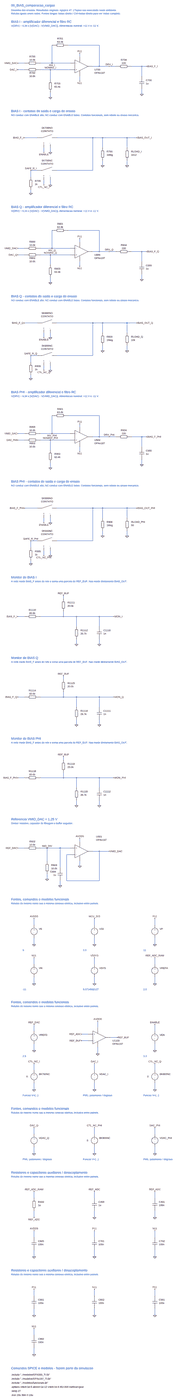
[diagram p0: schematic 06_BIAS_comparacao_cargas.asc, whole sheet]
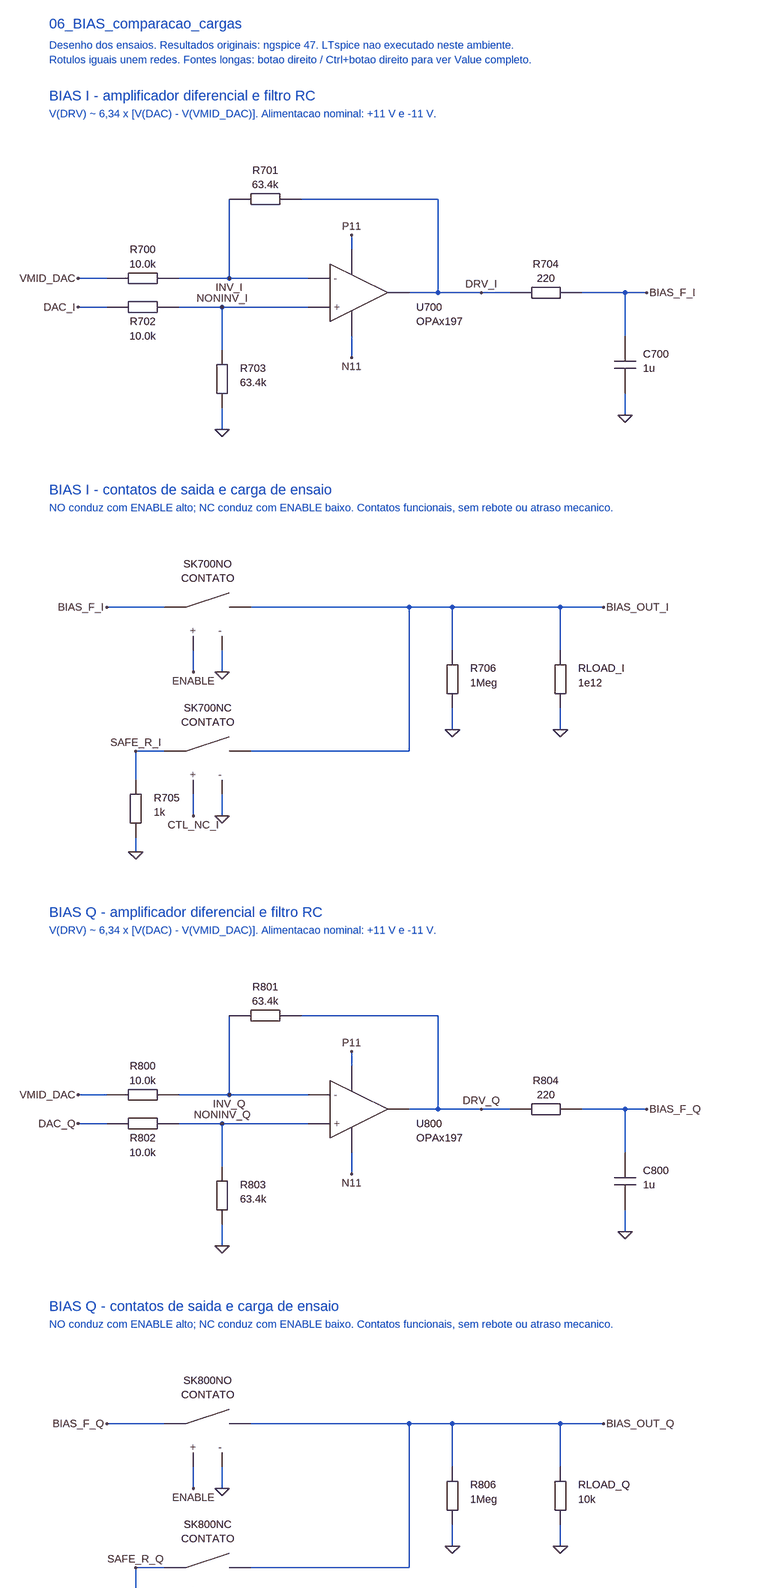
[diagram p1: schematic 06_BIAS_comparacao_cargas.asc, part, row 1 of 4, column 1 of 1]
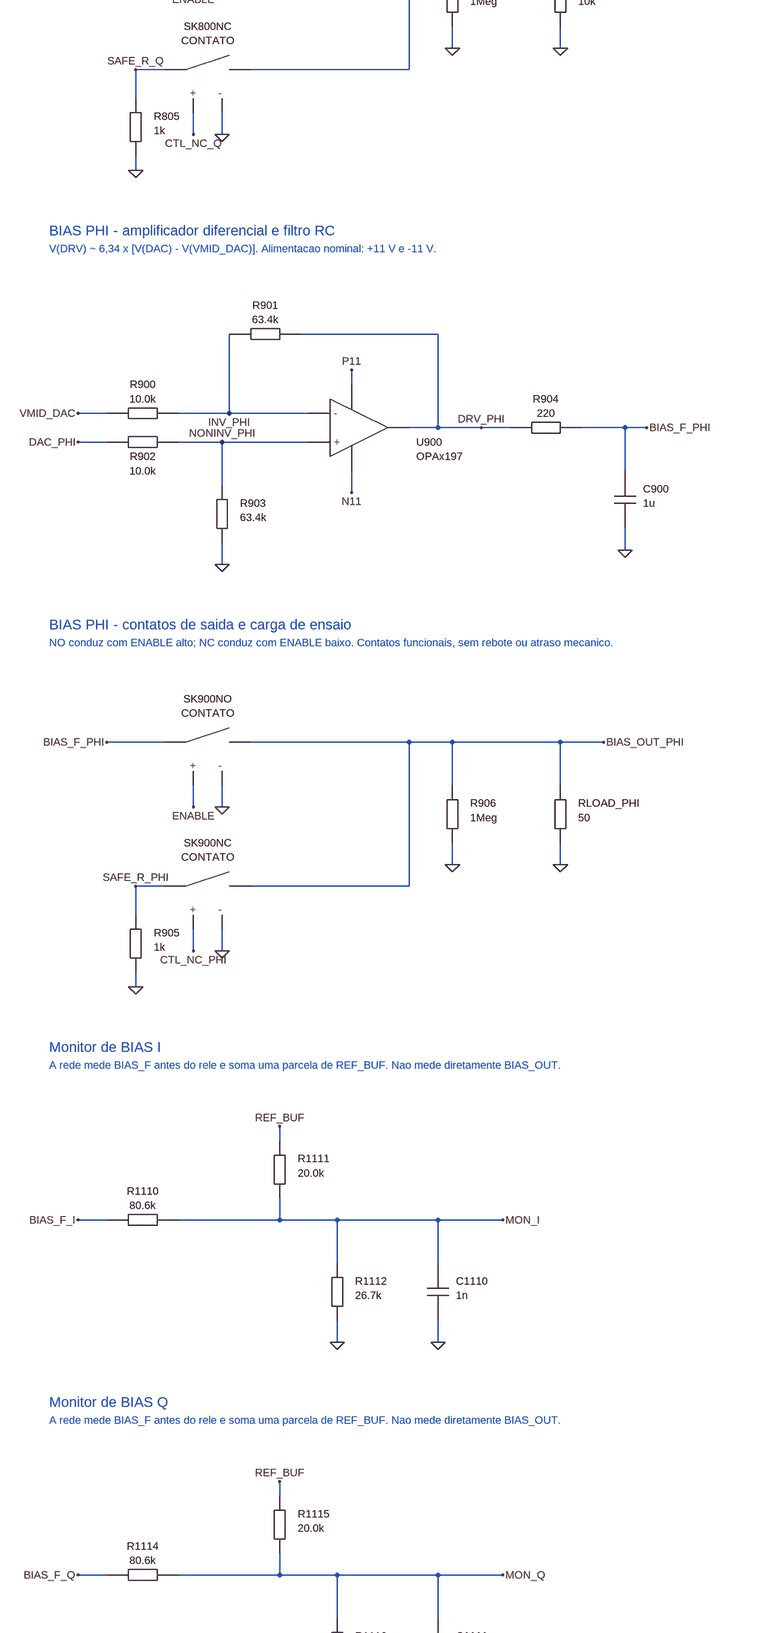
[diagram p2: schematic 06_BIAS_comparacao_cargas.asc, part, row 2 of 4, column 1 of 1]
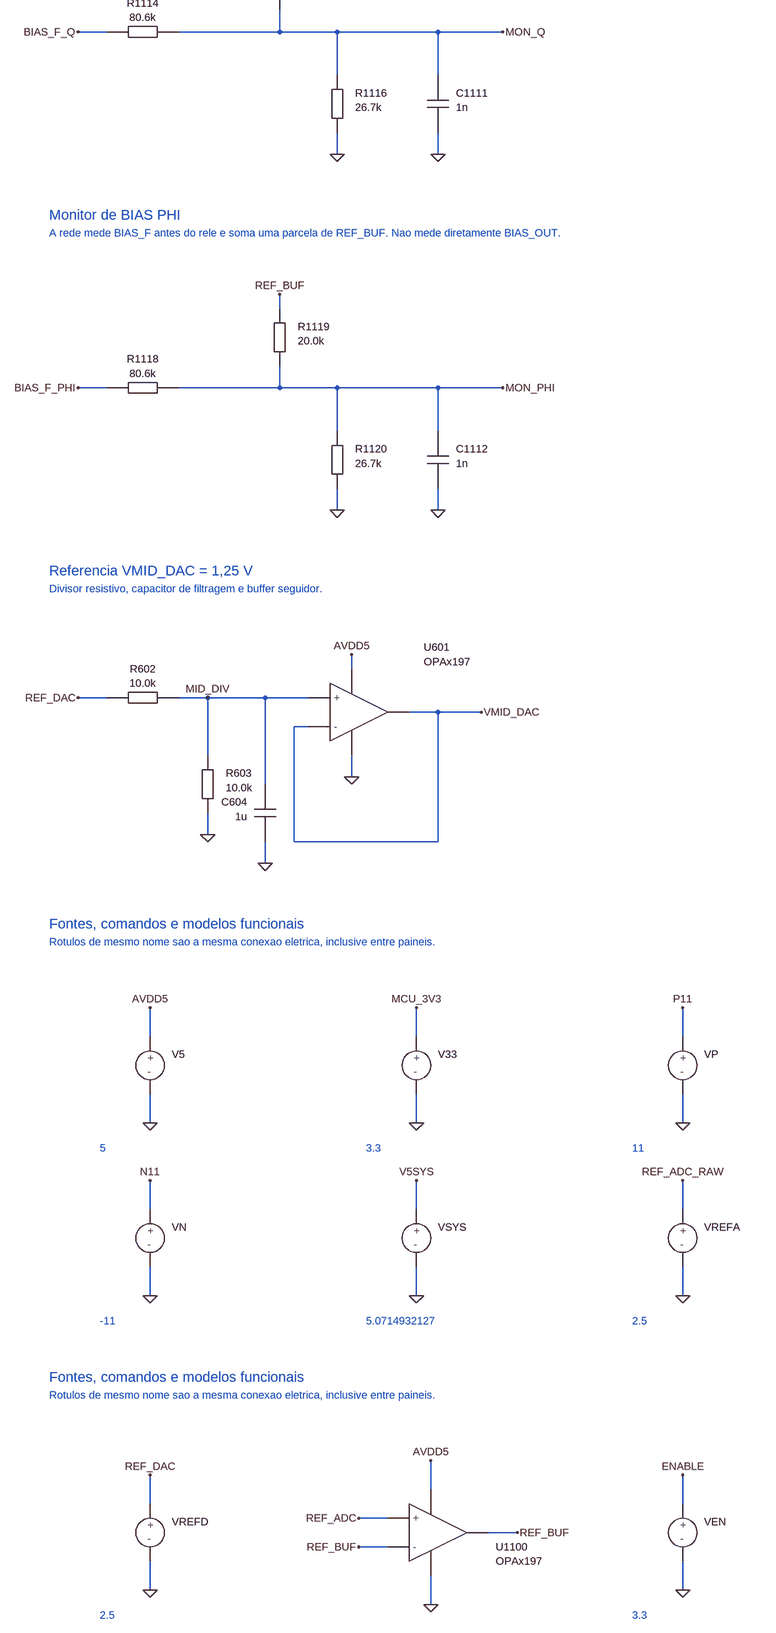
[diagram p3: schematic 06_BIAS_comparacao_cargas.asc, part, row 3 of 4, column 1 of 1]
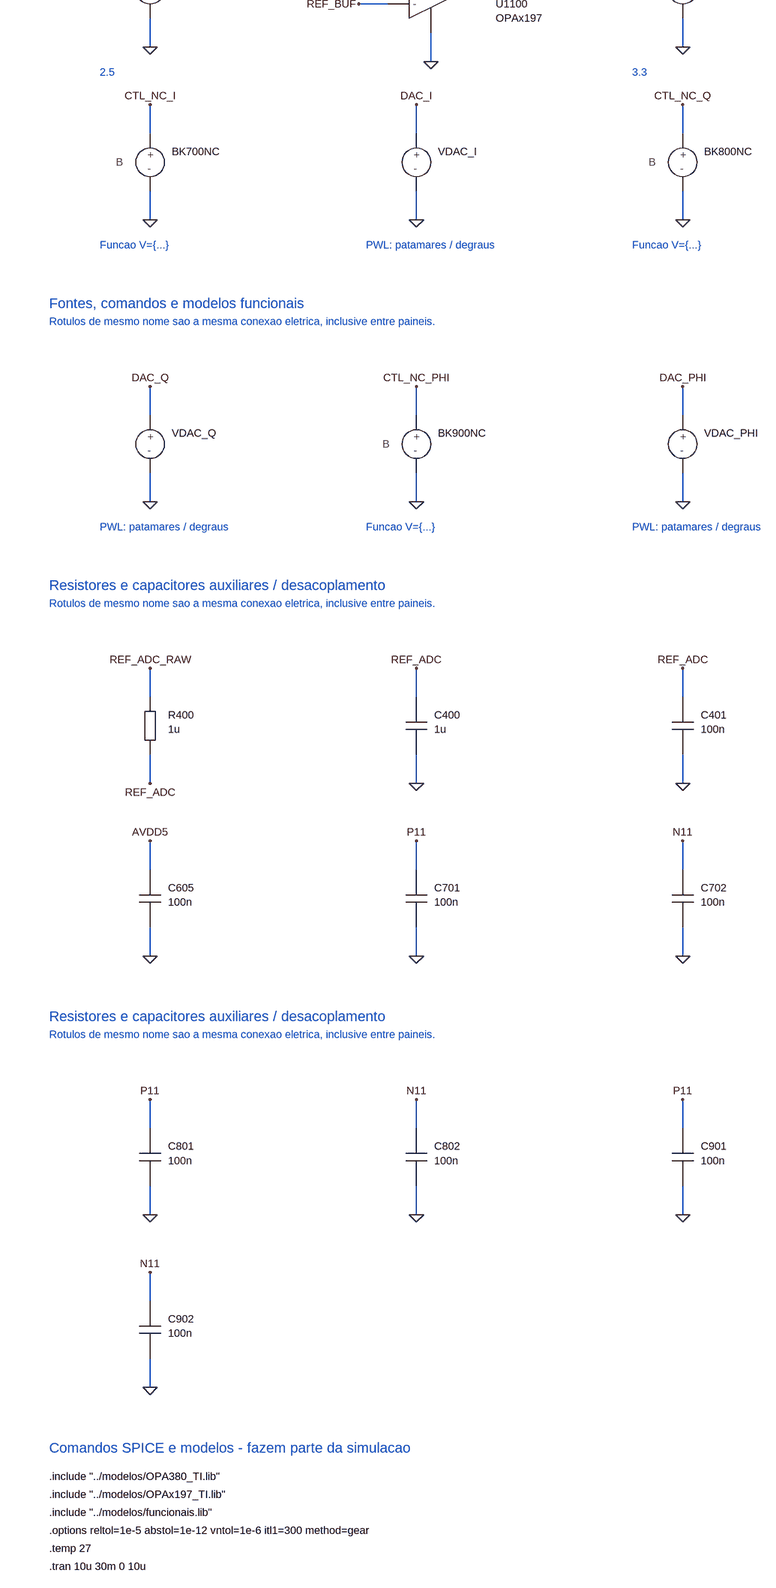
[diagram p4: schematic 06_BIAS_comparacao_cargas.asc, part, row 4 of 4, column 1 of 1]
06_BIAS_comparacao_cargas.asc, the LTspice schematic file:
Version 4.1
SHEET 1 1968 16096
TEXT 64 32 Left 3 ;06_BIAS_comparacao_cargas
TEXT 64 80 Left 2 ;Desenho dos ensaios. Resultados originais: ngspice 47. LTspice nao executado neste ambiente.
TEXT 64 112 Left 2 ;Rotulos iguais unem redes. Fontes longas: botao direito / Ctrl+botao direito para ver Value completo.
TEXT 64 192 Left 3 ;BIAS I - amplificador diferencial e filtro RC
TEXT 64 232 Left 2 ;V(DRV) ~ 6,34 x [V(DAC) - V(VMID_DAC)]. Alimentacao nominal: +11 V e -11 V.
WIRE 192 608 128 608
WIRE 352 608 640 608
WIRE 464 608 464 432
WIRE 624 432 928 432
WIRE 928 432 928 640
WIRE 928 640 864 640
WIRE 192 672 128 672
WIRE 352 672 640 672
WIRE 448 672 448 768
WIRE 448 896 448 944
WIRE 736 544 736 512
WIRE 736 736 736 784
WIRE 928 640 1088 640
WIRE 1248 640 1392 640
WIRE 1344 640 1344 736
WIRE 1344 864 1344 912
FLAG 128 608 VMID_DAC
FLAG 128 672 DAC_I
FLAG 448 944 0
FLAG 736 512 P11
FLAG 736 784 N11
FLAG 1024 640 DRV_I
FLAG 1392 640 BIAS_F_I
FLAG 1344 912 0
FLAG 464 608 INV_I
FLAG 448 672 NONINV_I
SYMBOL CV_RH 192 608 R0
SYMATTR InstName R700
SYMATTR Value 10.0k
SYMBOL CV_RHR 464 432 R0
SYMATTR InstName R701
SYMATTR Value 63.4k
SYMBOL CV_RHB 192 672 R0
SYMATTR InstName R702
SYMATTR Value 10.0k
SYMBOL CV_RV 448 768 R0
SYMATTR InstName R703
SYMATTR Value 63.4k
SYMBOL CV_OPD 704 576 R0
SYMATTR InstName U700
SYMATTR Value OPAx197
SYMBOL CV_RH 1088 640 R0
SYMATTR InstName R704
SYMATTR Value 220
SYMBOL CV_CV 1344 736 R0
SYMATTR InstName C700
SYMATTR Value 1u
TEXT 64 1200 Left 3 ;BIAS I - contatos de saida e carga de ensaio
TEXT 64 1240 Left 2 ;NO conduz com ENABLE alto; NC conduz com ENABLE baixo. Contatos funcionais, sem rebote ou atraso mecanico.
WIRE 320 1584 192 1584
WIRE 512 1584 1296 1584
WIRE 512 1904 864 1904
WIRE 864 1904 864 1584
WIRE 384 1680 384 1728
WIRE 448 1680 448 1728
WIRE 384 2000 384 2048
WIRE 448 2000 448 2048
WIRE 320 1904 256 1904
WIRE 256 1904 256 1968
WIRE 256 2096 256 2128
WIRE 960 1584 960 1680
WIRE 960 1808 960 1856
WIRE 1200 1584 1200 1680
WIRE 1200 1808 1200 1856
FLAG 192 1584 BIAS_F_I
FLAG 1296 1584 BIAS_OUT_I
FLAG 384 1728 ENABLE
FLAG 448 1728 0
FLAG 384 2048 CTL_NC_I
FLAG 448 2048 0
FLAG 256 1904 SAFE_R_I
FLAG 256 2128 0
FLAG 960 1856 0
FLAG 1200 1856 0
SYMBOL CV_SW 384 1584 R0
SYMATTR InstName SK700NO
SYMATTR Value CONTATO
SYMBOL CV_SW 384 1904 R0
SYMATTR InstName SK700NC
SYMATTR Value CONTATO
SYMBOL CV_RV 256 1968 R0
SYMATTR InstName R705
SYMATTR Value 1k
SYMBOL CV_RV 960 1680 R0
SYMATTR InstName R706
SYMATTR Value 1Meg
SYMBOL CV_RV 1200 1680 R0
SYMATTR InstName RLOAD_I
SYMATTR Value 1e12
TEXT 64 2352 Left 3 ;BIAS Q - amplificador diferencial e filtro RC
TEXT 64 2392 Left 2 ;V(DRV) ~ 6,34 x [V(DAC) - V(VMID_DAC)]. Alimentacao nominal: +11 V e -11 V.
WIRE 192 2768 128 2768
WIRE 352 2768 640 2768
WIRE 464 2768 464 2592
WIRE 624 2592 928 2592
WIRE 928 2592 928 2800
WIRE 928 2800 864 2800
WIRE 192 2832 128 2832
WIRE 352 2832 640 2832
WIRE 448 2832 448 2928
WIRE 448 3056 448 3104
WIRE 736 2704 736 2672
WIRE 736 2896 736 2944
WIRE 928 2800 1088 2800
WIRE 1248 2800 1392 2800
WIRE 1344 2800 1344 2896
WIRE 1344 3024 1344 3072
FLAG 128 2768 VMID_DAC
FLAG 128 2832 DAC_Q
FLAG 448 3104 0
FLAG 736 2672 P11
FLAG 736 2944 N11
FLAG 1024 2800 DRV_Q
FLAG 1392 2800 BIAS_F_Q
FLAG 1344 3072 0
FLAG 464 2768 INV_Q
FLAG 448 2832 NONINV_Q
SYMBOL CV_RH 192 2768 R0
SYMATTR InstName R800
SYMATTR Value 10.0k
SYMBOL CV_RHR 464 2592 R0
SYMATTR InstName R801
SYMATTR Value 63.4k
SYMBOL CV_RHB 192 2832 R0
SYMATTR InstName R802
SYMATTR Value 10.0k
SYMBOL CV_RV 448 2928 R0
SYMATTR InstName R803
SYMATTR Value 63.4k
SYMBOL CV_OPD 704 2736 R0
SYMATTR InstName U800
SYMATTR Value OPAx197
SYMBOL CV_RH 1088 2800 R0
SYMATTR InstName R804
SYMATTR Value 220
SYMBOL CV_CV 1344 2896 R0
SYMATTR InstName C800
SYMATTR Value 1u
TEXT 64 3360 Left 3 ;BIAS Q - contatos de saida e carga de ensaio
TEXT 64 3400 Left 2 ;NO conduz com ENABLE alto; NC conduz com ENABLE baixo. Contatos funcionais, sem rebote ou atraso mecanico.
WIRE 320 3744 192 3744
WIRE 512 3744 1296 3744
WIRE 512 4064 864 4064
WIRE 864 4064 864 3744
WIRE 384 3840 384 3888
WIRE 448 3840 448 3888
WIRE 384 4160 384 4208
WIRE 448 4160 448 4208
WIRE 320 4064 256 4064
WIRE 256 4064 256 4128
WIRE 256 4256 256 4288
WIRE 960 3744 960 3840
WIRE 960 3968 960 4016
WIRE 1200 3744 1200 3840
WIRE 1200 3968 1200 4016
FLAG 192 3744 BIAS_F_Q
FLAG 1296 3744 BIAS_OUT_Q
FLAG 384 3888 ENABLE
FLAG 448 3888 0
FLAG 384 4208 CTL_NC_Q
FLAG 448 4208 0
FLAG 256 4064 SAFE_R_Q
FLAG 256 4288 0
FLAG 960 4016 0
FLAG 1200 4016 0
SYMBOL CV_SW 384 3744 R0
SYMATTR InstName SK800NO
SYMATTR Value CONTATO
SYMBOL CV_SW 384 4064 R0
SYMATTR InstName SK800NC
SYMATTR Value CONTATO
SYMBOL CV_RV 256 4128 R0
SYMATTR InstName R805
SYMATTR Value 1k
SYMBOL CV_RV 960 3840 R0
SYMATTR InstName R806
SYMATTR Value 1Meg
SYMBOL CV_RV 1200 3840 R0
SYMATTR InstName RLOAD_Q
SYMATTR Value 10k
TEXT 64 4512 Left 3 ;BIAS PHI - amplificador diferencial e filtro RC
TEXT 64 4552 Left 2 ;V(DRV) ~ 6,34 x [V(DAC) - V(VMID_DAC)]. Alimentacao nominal: +11 V e -11 V.
WIRE 192 4928 128 4928
WIRE 352 4928 640 4928
WIRE 464 4928 464 4752
WIRE 624 4752 928 4752
WIRE 928 4752 928 4960
WIRE 928 4960 864 4960
WIRE 192 4992 128 4992
WIRE 352 4992 640 4992
WIRE 448 4992 448 5088
WIRE 448 5216 448 5264
WIRE 736 4864 736 4832
WIRE 736 5056 736 5104
WIRE 928 4960 1088 4960
WIRE 1248 4960 1392 4960
WIRE 1344 4960 1344 5056
WIRE 1344 5184 1344 5232
FLAG 128 4928 VMID_DAC
FLAG 128 4992 DAC_PHI
FLAG 448 5264 0
FLAG 736 4832 P11
FLAG 736 5104 N11
FLAG 1024 4960 DRV_PHI
FLAG 1392 4960 BIAS_F_PHI
FLAG 1344 5232 0
FLAG 464 4928 INV_PHI
FLAG 448 4992 NONINV_PHI
SYMBOL CV_RH 192 4928 R0
SYMATTR InstName R900
SYMATTR Value 10.0k
SYMBOL CV_RHR 464 4752 R0
SYMATTR InstName R901
SYMATTR Value 63.4k
SYMBOL CV_RHB 192 4992 R0
SYMATTR InstName R902
SYMATTR Value 10.0k
SYMBOL CV_RV 448 5088 R0
SYMATTR InstName R903
SYMATTR Value 63.4k
SYMBOL CV_OPD 704 4896 R0
SYMATTR InstName U900
SYMATTR Value OPAx197
SYMBOL CV_RH 1088 4960 R0
SYMATTR InstName R904
SYMATTR Value 220
SYMBOL CV_CV 1344 5056 R0
SYMATTR InstName C900
SYMATTR Value 1u
TEXT 64 5520 Left 3 ;BIAS PHI - contatos de saida e carga de ensaio
TEXT 64 5560 Left 2 ;NO conduz com ENABLE alto; NC conduz com ENABLE baixo. Contatos funcionais, sem rebote ou atraso mecanico.
WIRE 320 5904 192 5904
WIRE 512 5904 1296 5904
WIRE 512 6224 864 6224
WIRE 864 6224 864 5904
WIRE 384 6000 384 6048
WIRE 448 6000 448 6048
WIRE 384 6320 384 6368
WIRE 448 6320 448 6368
WIRE 320 6224 256 6224
WIRE 256 6224 256 6288
WIRE 256 6416 256 6448
WIRE 960 5904 960 6000
WIRE 960 6128 960 6176
WIRE 1200 5904 1200 6000
WIRE 1200 6128 1200 6176
FLAG 192 5904 BIAS_F_PHI
FLAG 1296 5904 BIAS_OUT_PHI
FLAG 384 6048 ENABLE
FLAG 448 6048 0
FLAG 384 6368 CTL_NC_PHI
FLAG 448 6368 0
FLAG 256 6224 SAFE_R_PHI
FLAG 256 6448 0
FLAG 960 6176 0
FLAG 1200 6176 0
SYMBOL CV_SW 384 5904 R0
SYMATTR InstName SK900NO
SYMATTR Value CONTATO
SYMBOL CV_SW 384 6224 R0
SYMATTR InstName SK900NC
SYMATTR Value CONTATO
SYMBOL CV_RV 256 6288 R0
SYMATTR InstName R905
SYMATTR Value 1k
SYMBOL CV_RV 960 6000 R0
SYMATTR InstName R906
SYMATTR Value 1Meg
SYMBOL CV_RV 1200 6000 R0
SYMATTR InstName RLOAD_PHI
SYMATTR Value 50
TEXT 64 6672 Left 3 ;Monitor de BIAS I
TEXT 64 6712 Left 2 ;A rede mede BIAS_F antes do rele e soma uma parcela de REF_BUF. Nao mede diretamente BIAS_OUT.
WIRE 192 7056 128 7056
WIRE 352 7056 1072 7056
WIRE 576 6880 576 6848
WIRE 576 7008 576 7056
WIRE 704 7056 704 7152
WIRE 704 7280 704 7328
WIRE 928 7056 928 7152
WIRE 928 7280 928 7328
FLAG 128 7056 BIAS_F_I
FLAG 1072 7056 MON_I
FLAG 576 6848 REF_BUF
FLAG 704 7328 0
FLAG 928 7328 0
SYMBOL CV_RH 192 7056 R0
SYMATTR InstName R1110
SYMATTR Value 80.6k
SYMBOL CV_RV 576 6880 R0
SYMATTR InstName R1111
SYMATTR Value 20.0k
SYMBOL CV_RV 704 7152 R0
SYMATTR InstName R1112
SYMATTR Value 26.7k
SYMBOL CV_CV 928 7152 R0
SYMATTR InstName C1110
SYMATTR Value 1n
TEXT 64 7568 Left 3 ;Monitor de BIAS Q
TEXT 64 7608 Left 2 ;A rede mede BIAS_F antes do rele e soma uma parcela de REF_BUF. Nao mede diretamente BIAS_OUT.
WIRE 192 7952 128 7952
WIRE 352 7952 1072 7952
WIRE 576 7776 576 7744
WIRE 576 7904 576 7952
WIRE 704 7952 704 8048
WIRE 704 8176 704 8224
WIRE 928 7952 928 8048
WIRE 928 8176 928 8224
FLAG 128 7952 BIAS_F_Q
FLAG 1072 7952 MON_Q
FLAG 576 7744 REF_BUF
FLAG 704 8224 0
FLAG 928 8224 0
SYMBOL CV_RH 192 7952 R0
SYMATTR InstName R1114
SYMATTR Value 80.6k
SYMBOL CV_RV 576 7776 R0
SYMATTR InstName R1115
SYMATTR Value 20.0k
SYMBOL CV_RV 704 8048 R0
SYMATTR InstName R1116
SYMATTR Value 26.7k
SYMBOL CV_CV 928 8048 R0
SYMATTR InstName C1111
SYMATTR Value 1n
TEXT 64 8464 Left 3 ;Monitor de BIAS PHI
TEXT 64 8504 Left 2 ;A rede mede BIAS_F antes do rele e soma uma parcela de REF_BUF. Nao mede diretamente BIAS_OUT.
WIRE 192 8848 128 8848
WIRE 352 8848 1072 8848
WIRE 576 8672 576 8640
WIRE 576 8800 576 8848
WIRE 704 8848 704 8944
WIRE 704 9072 704 9120
WIRE 928 8848 928 8944
WIRE 928 9072 928 9120
FLAG 128 8848 BIAS_F_PHI
FLAG 1072 8848 MON_PHI
FLAG 576 8640 REF_BUF
FLAG 704 9120 0
FLAG 928 9120 0
SYMBOL CV_RH 192 8848 R0
SYMATTR InstName R1118
SYMATTR Value 80.6k
SYMBOL CV_RV 576 8672 R0
SYMATTR InstName R1119
SYMATTR Value 20.0k
SYMBOL CV_RV 704 8944 R0
SYMATTR InstName R1120
SYMATTR Value 26.7k
SYMBOL CV_CV 928 8944 R0
SYMATTR InstName C1112
SYMATTR Value 1n
TEXT 64 9360 Left 3 ;Referencia VMID_DAC = 1,25 V
TEXT 64 9400 Left 2 ;Divisor resistivo, capacitor de filtragem e buffer seguidor.
WIRE 192 9712 128 9712
WIRE 352 9712 640 9712
WIRE 416 9712 416 9840
WIRE 416 9968 416 10016
WIRE 544 9712 544 9904
WIRE 544 10032 544 10080
WIRE 736 9648 736 9616
WIRE 736 9840 736 9888
WIRE 640 9776 608 9776
WIRE 608 9776 608 10032
WIRE 608 10032 928 10032
WIRE 928 10032 928 9744
WIRE 928 9744 864 9744
WIRE 928 9744 1024 9744
FLAG 128 9712 REF_DAC
FLAG 416 10016 0
FLAG 544 10080 0
FLAG 736 9616 AVDD5
FLAG 736 9888 0
FLAG 1024 9744 VMID_DAC
FLAG 416 9712 MID_DIV
SYMBOL CV_RH 192 9712 R0
SYMATTR InstName R602
SYMATTR Value 10.0k
SYMBOL CV_RV 416 9840 R0
SYMATTR InstName R603
SYMATTR Value 10.0k
SYMBOL CV_CVL 544 9904 R0
SYMATTR InstName C604
SYMATTR Value 1u
SYMBOL CV_OPF 704 9680 R0
SYMATTR InstName U601
SYMATTR Value OPAx197
TEXT 64 10320 Left 3 ;Fontes, comandos e modelos funcionais
TEXT 64 10360 Left 2 ;Rotulos de mesmo nome sao a mesma conexao eletrica, inclusive entre paineis.
WIRE 288 10640 288 10576
WIRE 288 10768 288 10832
WIRE 880 10640 880 10576
WIRE 880 10768 880 10832
WIRE 1472 10640 1472 10576
WIRE 1472 10768 1472 10832
WIRE 288 11024 288 10960
WIRE 288 11152 288 11216
WIRE 880 11024 880 10960
WIRE 880 11152 880 11216
WIRE 1472 11024 1472 10960
WIRE 1472 11152 1472 11216
FLAG 288 10576 AVDD5
FLAG 288 10832 0
FLAG 880 10576 MCU_3V3
FLAG 880 10832 0
FLAG 1472 10576 P11
FLAG 1472 10832 0
FLAG 288 10960 N11
FLAG 288 11216 0
FLAG 880 10960 V5SYS
FLAG 880 11216 0
FLAG 1472 10960 REF_ADC_RAW
FLAG 1472 11216 0
SYMBOL CV_V 288 10640 R0
SYMATTR InstName V5
SYMATTR Value 5
SYMBOL CV_V 880 10640 R0
SYMATTR InstName V33
SYMATTR Value 3.3
SYMBOL CV_V 1472 10640 R0
SYMATTR InstName VP
SYMATTR Value 11
SYMBOL CV_V 288 11024 R0
SYMATTR InstName VN
SYMATTR Value -11
SYMBOL CV_V 880 11024 R0
SYMATTR InstName VSYS
SYMATTR Value 5.0714932127
SYMBOL CV_V 1472 11024 R0
SYMATTR InstName VREFA
SYMATTR Value 2.5
TEXT 176 10888 Left 2 ;5
TEXT 768 10888 Left 2 ;3.3
TEXT 1360 10888 Left 2 ;11
TEXT 176 11272 Left 2 ;-11
TEXT 768 11272 Left 2 ;5.0714932127
TEXT 1360 11272 Left 2 ;2.5
TEXT 64 11472 Left 3 ;Fontes, comandos e modelos funcionais
TEXT 64 11512 Left 2 ;Rotulos de mesmo nome sao a mesma conexao eletrica, inclusive entre paineis.
WIRE 288 11792 288 11728
WIRE 288 11920 288 11984
WIRE 816 11824 752 11824
WIRE 816 11888 752 11888
WIRE 912 11760 912 11696
WIRE 912 11952 912 12016
WIRE 1040 11856 1104 11856
WIRE 1472 11792 1472 11728
WIRE 1472 11920 1472 11984
WIRE 288 12176 288 12112
WIRE 288 12304 288 12368
WIRE 880 12176 880 12112
WIRE 880 12304 880 12368
WIRE 1472 12176 1472 12112
WIRE 1472 12304 1472 12368
FLAG 288 11728 REF_DAC
FLAG 288 11984 0
FLAG 752 11824 REF_ADC
FLAG 752 11888 REF_BUF
FLAG 912 11696 AVDD5
FLAG 912 12016 0
FLAG 1104 11856 REF_BUF
FLAG 1472 11728 ENABLE
FLAG 1472 11984 0
FLAG 288 12112 CTL_NC_I
FLAG 288 12368 0
FLAG 880 12112 DAC_I
FLAG 880 12368 0
FLAG 1472 12112 CTL_NC_Q
FLAG 1472 12368 0
SYMBOL CV_V 288 11792 R0
SYMATTR InstName VREFD
SYMATTR Value 2.5
SYMBOL CV_OP 880 11792 R0
SYMATTR InstName U1100
SYMATTR Value OPAx197
SYMBOL CV_V 1472 11792 R0
SYMATTR InstName VEN
SYMATTR Value 3.3
SYMBOL CV_B 288 12176 R0
SYMATTR InstName BK700NC
SYMATTR Value V={3.3-V(ENABLE)}
SYMBOL CV_V 880 12176 R0
SYMATTR InstName VDAC_I
SYMATTR Value PWL(0 1.25 5m 1.25 5.01m 0.855678233438)
SYMBOL CV_B 1472 12176 R0
SYMATTR InstName BK800NC
SYMATTR Value V={3.3-V(ENABLE)}
TEXT 176 12040 Left 2 ;2.5
TEXT 1360 12040 Left 2 ;3.3
TEXT 176 12424 Left 2 ;Funcao V={...}
TEXT 768 12424 Left 2 ;PWL: patamares / degraus
TEXT 1360 12424 Left 2 ;Funcao V={...}
TEXT 64 12624 Left 3 ;Fontes, comandos e modelos funcionais
TEXT 64 12664 Left 2 ;Rotulos de mesmo nome sao a mesma conexao eletrica, inclusive entre paineis.
WIRE 288 12944 288 12880
WIRE 288 13072 288 13136
WIRE 880 12944 880 12880
WIRE 880 13072 880 13136
WIRE 1472 12944 1472 12880
WIRE 1472 13072 1472 13136
FLAG 288 12880 DAC_Q
FLAG 288 13136 0
FLAG 880 12880 CTL_NC_PHI
FLAG 880 13136 0
FLAG 1472 12880 DAC_PHI
FLAG 1472 13136 0
SYMBOL CV_V 288 12944 R0
SYMATTR InstName VDAC_Q
SYMATTR Value PWL(0 1.25 5m 1.25 5.01m 0.855678233438)
SYMBOL CV_B 880 12944 R0
SYMATTR InstName BK900NC
SYMATTR Value V={3.3-V(ENABLE)}
SYMBOL CV_V 1472 12944 R0
SYMATTR InstName VDAC_PHI
SYMATTR Value PWL(0 1.25 5m 1.25 5.01m 0.855678233438)
TEXT 176 13192 Left 2 ;PWL: patamares / degraus
TEXT 768 13192 Left 2 ;Funcao V={...}
TEXT 1360 13192 Left 2 ;PWL: patamares / degraus
TEXT 64 13392 Left 3 ;Resistores e capacitores auxiliares / desacoplamento
TEXT 64 13432 Left 2 ;Rotulos de mesmo nome sao a mesma conexao eletrica, inclusive entre paineis.
WIRE 288 13712 288 13648
WIRE 288 13840 288 13904
WIRE 880 13712 880 13648
WIRE 880 13840 880 13904
WIRE 1472 13712 1472 13648
WIRE 1472 13840 1472 13904
WIRE 288 14096 288 14032
WIRE 288 14224 288 14288
WIRE 880 14096 880 14032
WIRE 880 14224 880 14288
WIRE 1472 14096 1472 14032
WIRE 1472 14224 1472 14288
FLAG 288 13648 REF_ADC_RAW
FLAG 288 13904 REF_ADC
FLAG 880 13648 REF_ADC
FLAG 880 13904 0
FLAG 1472 13648 REF_ADC
FLAG 1472 13904 0
FLAG 288 14032 AVDD5
FLAG 288 14288 0
FLAG 880 14032 P11
FLAG 880 14288 0
FLAG 1472 14032 N11
FLAG 1472 14288 0
SYMBOL CV_RV 288 13712 R0
SYMATTR InstName R400
SYMATTR Value 1u
SYMBOL CV_CV 880 13712 R0
SYMATTR InstName C400
SYMATTR Value 1u
SYMBOL CV_CV 1472 13712 R0
SYMATTR InstName C401
SYMATTR Value 100n
SYMBOL CV_CV 288 14096 R0
SYMATTR InstName C605
SYMATTR Value 100n
SYMBOL CV_CV 880 14096 R0
SYMATTR InstName C701
SYMATTR Value 100n
SYMBOL CV_CV 1472 14096 R0
SYMATTR InstName C702
SYMATTR Value 100n
TEXT 64 14544 Left 3 ;Resistores e capacitores auxiliares / desacoplamento
TEXT 64 14584 Left 2 ;Rotulos de mesmo nome sao a mesma conexao eletrica, inclusive entre paineis.
WIRE 288 14864 288 14800
WIRE 288 14992 288 15056
WIRE 880 14864 880 14800
WIRE 880 14992 880 15056
WIRE 1472 14864 1472 14800
WIRE 1472 14992 1472 15056
WIRE 288 15248 288 15184
WIRE 288 15376 288 15440
FLAG 288 14800 P11
FLAG 288 15056 0
FLAG 880 14800 N11
FLAG 880 15056 0
FLAG 1472 14800 P11
FLAG 1472 15056 0
FLAG 288 15184 N11
FLAG 288 15440 0
SYMBOL CV_CV 288 14864 R0
SYMATTR InstName C801
SYMATTR Value 100n
SYMBOL CV_CV 880 14864 R0
SYMATTR InstName C802
SYMATTR Value 100n
SYMBOL CV_CV 1472 14864 R0
SYMATTR InstName C901
SYMATTR Value 100n
SYMBOL CV_CV 288 15248 R0
SYMATTR InstName C902
SYMATTR Value 100n
TEXT 64 15696 Left 3 ;Comandos SPICE e modelos - fazem parte da simulacao
TEXT 64 15760 Left 2 !.include "../modelos/OPA380_TI.lib"
TEXT 64 15800 Left 2 !.include "../modelos/OPAx197_TI.lib"
TEXT 64 15840 Left 2 !.include "../modelos/funcionais.lib"
TEXT 64 15880 Left 2 !.options reltol=1e-5 abstol=1e-12 vntol=1e-6 itl1=300 method=gear
TEXT 64 15920 Left 2 !.temp 27
TEXT 64 15960 Left 2 !.tran 10u 30m 0 10u

The netlist it stands for:
* 06_BIAS_comparacao_cargas.asc
R700 VMID_DAC INV_I 10.0k
R701 DRV_I INV_I 63.4k
R702 DAC_I NONINV_I 10.0k
R703 NONINV_I 0 63.4k
X§U700 NONINV_I INV_I P11 N11 DRV_I OPAx197  ; pins + - V+ V- OUT
R704 DRV_I BIAS_F_I 220
C700 BIAS_F_I 0 1u
SK700NO BIAS_F_I BIAS_OUT_I ENABLE 0 CONTATO
SK700NC SAFE_R_I BIAS_OUT_I CTL_NC_I 0 CONTATO
R705 SAFE_R_I 0 1k
R706 BIAS_OUT_I 0 1Meg
RLOAD_I BIAS_OUT_I 0 1e12
R800 VMID_DAC INV_Q 10.0k
R801 DRV_Q INV_Q 63.4k
R802 DAC_Q NONINV_Q 10.0k
R803 NONINV_Q 0 63.4k
X§U800 NONINV_Q INV_Q P11 N11 DRV_Q OPAx197  ; pins + - V+ V- OUT
R804 DRV_Q BIAS_F_Q 220
C800 BIAS_F_Q 0 1u
SK800NO BIAS_F_Q BIAS_OUT_Q ENABLE 0 CONTATO
SK800NC SAFE_R_Q BIAS_OUT_Q CTL_NC_Q 0 CONTATO
R805 SAFE_R_Q 0 1k
R806 BIAS_OUT_Q 0 1Meg
RLOAD_Q BIAS_OUT_Q 0 10k
R900 VMID_DAC INV_PHI 10.0k
R901 DRV_PHI INV_PHI 63.4k
R902 DAC_PHI NONINV_PHI 10.0k
R903 NONINV_PHI 0 63.4k
X§U900 NONINV_PHI INV_PHI P11 N11 DRV_PHI OPAx197  ; pins + - V+ V- OUT
R904 DRV_PHI BIAS_F_PHI 220
C900 BIAS_F_PHI 0 1u
SK900NO BIAS_F_PHI BIAS_OUT_PHI ENABLE 0 CONTATO
SK900NC SAFE_R_PHI BIAS_OUT_PHI CTL_NC_PHI 0 CONTATO
R905 SAFE_R_PHI 0 1k
R906 BIAS_OUT_PHI 0 1Meg
RLOAD_PHI BIAS_OUT_PHI 0 50
R1110 BIAS_F_I MON_I 80.6k
R1111 REF_BUF MON_I 20.0k
R1112 MON_I 0 26.7k
C1110 MON_I 0 1n
R1114 BIAS_F_Q MON_Q 80.6k
R1115 REF_BUF MON_Q 20.0k
R1116 MON_Q 0 26.7k
C1111 MON_Q 0 1n
R1118 BIAS_F_PHI MON_PHI 80.6k
R1119 REF_BUF MON_PHI 20.0k
R1120 MON_PHI 0 26.7k
C1112 MON_PHI 0 1n
R602 REF_DAC MID_DIV 10.0k
R603 MID_DIV 0 10.0k
C604 MID_DIV 0 1u
X§U601 MID_DIV VMID_DAC AVDD5 0 VMID_DAC OPAx197  ; pins + - V+ V- OUT
V5 AVDD5 0 5
V33 MCU_3V3 0 3.3
VP P11 0 11
VN N11 0 -11
VSYS V5SYS 0 5.0714932127
VREFA REF_ADC_RAW 0 2.5
VREFD REF_DAC 0 2.5
X§U1100 REF_ADC REF_BUF AVDD5 0 REF_BUF OPAx197  ; pins + - V+ V- OUT
VEN ENABLE 0 3.3
BK700NC CTL_NC_I 0 V={3.3-V(ENABLE)}
VDAC_I DAC_I 0 PWL(0 1.25 5m 1.25 5.01m 0.855678233438)
BK800NC CTL_NC_Q 0 V={3.3-V(ENABLE)}
VDAC_Q DAC_Q 0 PWL(0 1.25 5m 1.25 5.01m 0.855678233438)
BK900NC CTL_NC_PHI 0 V={3.3-V(ENABLE)}
VDAC_PHI DAC_PHI 0 PWL(0 1.25 5m 1.25 5.01m 0.855678233438)
R400 REF_ADC_RAW REF_ADC 1u
C400 REF_ADC 0 1u
C401 REF_ADC 0 100n
C605 AVDD5 0 100n
C701 P11 0 100n
C702 N11 0 100n
C801 P11 0 100n
C802 N11 0 100n
C901 P11 0 100n
C902 N11 0 100n
* 06_BIAS_comparacao_cargas
* Desenho dos ensaios. Resultados originais: ngspice 47. LTspice nao executado neste ambiente.
* Rotulos iguais unem redes. Fontes longas: botao direito / Ctrl+botao direito para ver Value completo.
* BIAS I - amplificador diferencial e filtro RC
* V(DRV) ~ 6,34 x [V(DAC) - V(VMID_DAC)]. Alimentacao nominal: +11 V e -11 V.
* BIAS I - contatos de saida e carga de ensaio
* NO conduz com ENABLE alto; NC conduz com ENABLE baixo. Contatos funcionais, sem rebote ou atraso mecanico.
* BIAS Q - amplificador diferencial e filtro RC
* V(DRV) ~ 6,34 x [V(DAC) - V(VMID_DAC)]. Alimentacao nominal: +11 V e -11 V.
* BIAS Q - contatos de saida e carga de ensaio
* NO conduz com ENABLE alto; NC conduz com ENABLE baixo. Contatos funcionais, sem rebote ou atraso mecanico.
* BIAS PHI - amplificador diferencial e filtro RC
* V(DRV) ~ 6,34 x [V(DAC) - V(VMID_DAC)]. Alimentacao nominal: +11 V e -11 V.
* BIAS PHI - contatos de saida e carga de ensaio
* NO conduz com ENABLE alto; NC conduz com ENABLE baixo. Contatos funcionais, sem rebote ou atraso mecanico.
* Monitor de BIAS I
* A rede mede BIAS_F antes do rele e soma uma parcela de REF_BUF. Nao mede diretamente BIAS_OUT.
* Monitor de BIAS Q
* A rede mede BIAS_F antes do rele e soma uma parcela de REF_BUF. Nao mede diretamente BIAS_OUT.
* Monitor de BIAS PHI
* A rede mede BIAS_F antes do rele e soma uma parcela de REF_BUF. Nao mede diretamente BIAS_OUT.
* Referencia VMID_DAC = 1,25 V
* Divisor resistivo, capacitor de filtragem e buffer seguidor.
* Fontes, comandos e modelos funcionais
* Rotulos de mesmo nome sao a mesma conexao eletrica, inclusive entre paineis.
* 5
* 3.3
* 11
* -11
* 5.0714932127
* 2.5
* Fontes, comandos e modelos funcionais
* Rotulos de mesmo nome sao a mesma conexao eletrica, inclusive entre paineis.
* 2.5
* 3.3
* Funcao V={...}
* PWL: patamares / degraus
* Funcao V={...}
* Fontes, comandos e modelos funcionais
* Rotulos de mesmo nome sao a mesma conexao eletrica, inclusive entre paineis.
* PWL: patamares / degraus
* Funcao V={...}
* PWL: patamares / degraus
* Resistores e capacitores auxiliares / desacoplamento
* Rotulos de mesmo nome sao a mesma conexao eletrica, inclusive entre paineis.
* Resistores e capacitores auxiliares / desacoplamento
* Rotulos de mesmo nome sao a mesma conexao eletrica, inclusive entre paineis.
* Comandos SPICE e modelos - fazem parte da simulacao
.include "../modelos/OPA380_TI.lib"
.include "../modelos/OPAx197_TI.lib"
.include "../modelos/funcionais.lib"
.options reltol=1e-5 abstol=1e-12 vntol=1e-6 itl1=300 method=gear
.temp 27
.tran 10u 30m 0 10u
.backanno
.end